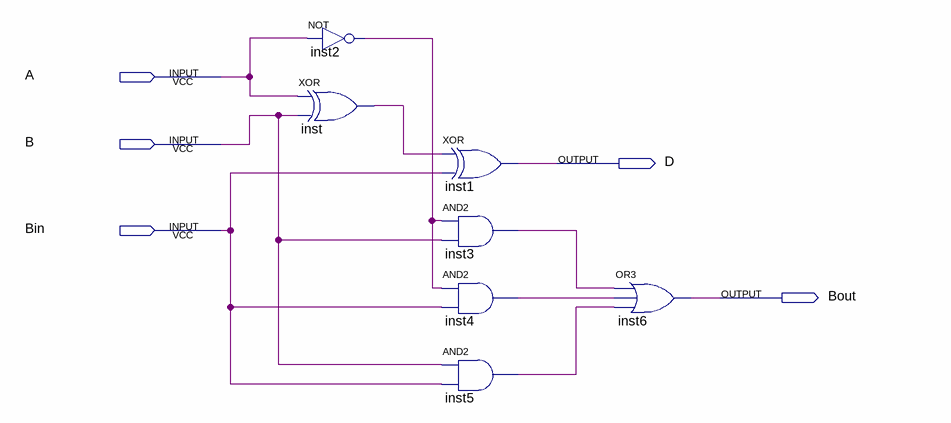
[diagram p0: schematic sheet]
// Quartus schematic sub.bdf as structural Verilog: 7 symbols, 5 pins
module sub (
  input  A,
  input  B,
  input  Bin,
  output D,
  output Bout
);

  wire inst2_out, inst3_out, inst4_out, inst5_out, inst_out;

  not inst2 (inst2_out, A);
  xor inst (inst_out, A, B);
  xor inst1 (D, inst_out, Bin);
  and inst3 (inst3_out, inst2_out, B);
  and inst4 (inst4_out, inst2_out, Bin);
  and inst5 (inst5_out, B, Bin);
  or inst6 (Bout, inst3_out, inst4_out, inst5_out);
endmodule
